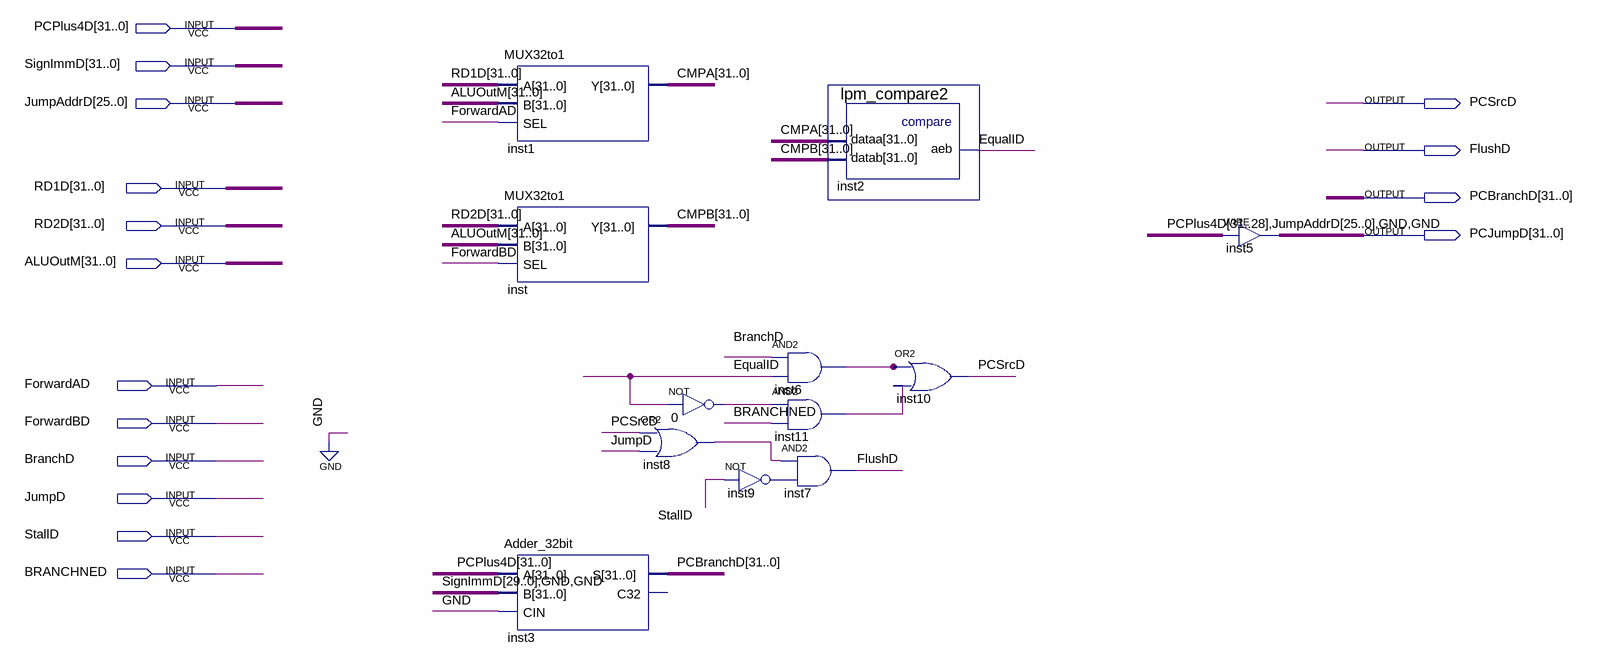
[diagram p0: schematic sheet]
// Quartus schematic Branch_Unit.bdf as structural Verilog: 12 symbols, 16 pins
module Branch_Unit (
  input  [31:0] PCPlus4D,
  input  [31:0] SignImmD,
  input  [25:0] JumpAddrD,
  input  [31:0] RD1D,
  input  [31:0] RD2D,
  input  [31:0] ALUOutM,
  input  ForwardAD,
  input  ForwardBD,
  input  BranchD,
  input  JumpD,
  input  StallD,
  input  BRANCHNED,
  output PCSrcD,
  output FlushD,
  output [31:0] PCBranchD,
  output [31:0] PCJumpD
);

  wire EqualID, inst6_out, inst8_out, inst9_out, inst11_out, n0_out;
  wire [31:0] CMPA, CMPB;

  MUX32to1 inst1 (.A(RD1D), .B(ALUOutM), .SEL(ForwardAD), .Y(CMPA));
  MUX32to1 inst (.A(RD2D), .B(ALUOutM), .SEL(ForwardBD), .Y(CMPB));
  Adder_32bit inst3 (.A(PCPlus4D), .B({SignImmD[29:0], 2'b00}), .CIN(1'b0), .S(PCBranchD));  // open: C32
  or inst8 (inst8_out, PCSrcD, JumpD);
  not u_0 (n0_out, EqualID);
  and inst6 (inst6_out, BranchD, EqualID);
  and inst11 (inst11_out, n0_out, BRANCHNED);
  and inst7 (FlushD, inst8_out, inst9_out);
  not inst9 (inst9_out, StallD);
  lpm_compare2 inst2 (.dataa(CMPA), .datab(CMPB), .aeb(EqualID));
  or inst10 (PCSrcD, inst6_out, inst11_out);
  assign PCJumpD = {PCPlus4D[31:28], JumpAddrD, 2'b00};  // WIRE inst5
endmodule
